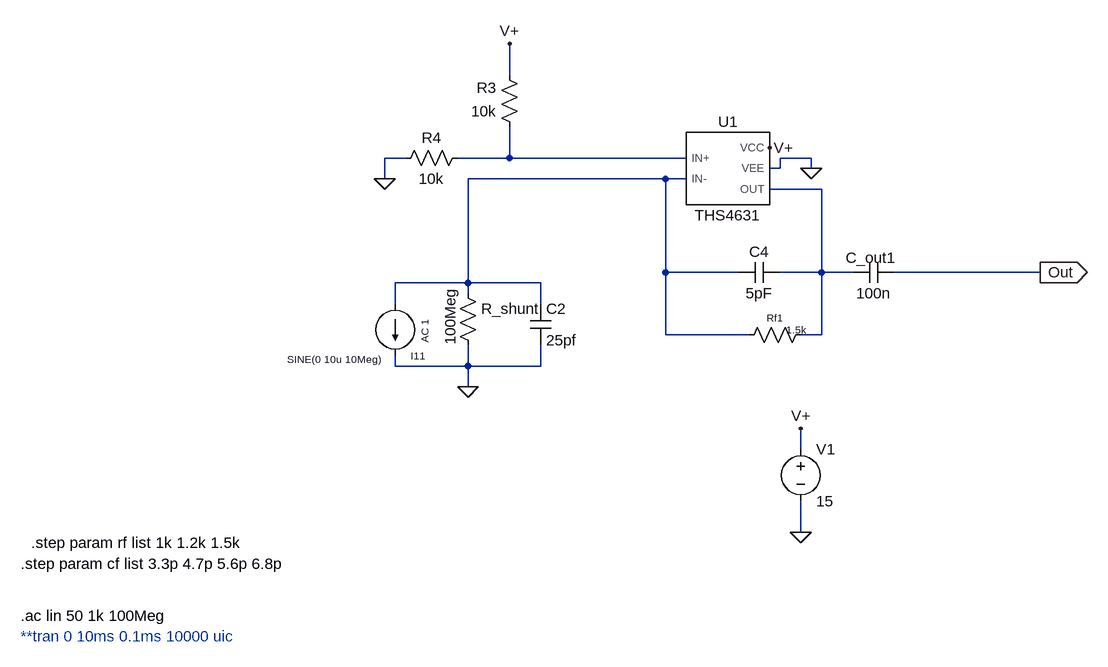
[diagram p0: schematic Receptor_V2_THS4631_b.asc]
Receptor_V2_THS4631_b.asc, the LTspice schematic file:
Version 4.1
SHEET 1 1892 1072
WIRE 784 -208 784 -256
WIRE 624 -80 592 -80
WIRE 784 -80 784 -128
WIRE 784 -80 704 -80
WIRE 1056 -80 784 -80
WIRE 1248 -80 1200 -80
WIRE 1200 -64 1200 -80
WIRE 1200 -64 1184 -64
WIRE 1248 -64 1248 -80
WIRE 592 -48 592 -80
WIRE 1024 -48 720 -48
WIRE 1056 -48 1024 -48
WIRE 1264 -32 1184 -32
WIRE 1024 96 1024 -48
WIRE 1136 96 1024 96
WIRE 1264 96 1264 -32
WIRE 1264 96 1200 96
WIRE 1312 96 1264 96
WIRE 1600 96 1376 96
WIRE 720 112 720 -48
WIRE 720 112 608 112
WIRE 832 112 720 112
WIRE 720 128 720 112
WIRE 608 144 608 112
WIRE 832 144 832 112
WIRE 1024 192 1024 96
WIRE 1152 192 1024 192
WIRE 1264 192 1264 96
WIRE 1264 192 1232 192
WIRE 608 240 608 224
WIRE 720 240 720 208
WIRE 720 240 608 240
WIRE 832 240 832 208
WIRE 832 240 720 240
WIRE 720 272 720 240
WIRE 1232 368 1232 336
WIRE 1232 496 1232 448
FLAG 1184 -96 V+
FLAG 1248 -64 0
FLAG 720 272 0
FLAG 1600 96 Out
IOPIN 1600 96 Out
FLAG 784 -256 V+
FLAG 592 -48 0
FLAG 1232 496 0
FLAG 1232 336 V+
SYMBOL THS4631 1120 -64 R0
SYMATTR InstName U1
SYMBOL res 1248 176 R90
WINDOW 0 0 56 VBottom 1
WINDOW 3 -2 23 VTop 1
SYMATTR InstName Rf1
SYMATTR Value 1.5k
SYMBOL cap 1376 80 R90
WINDOW 0 9 36 VBottom 2
WINDOW 3 32 32 VTop 2
SYMATTR InstName C_out1
SYMATTR Value 100n
SYMBOL current 608 144 R0
WINDOW 0 24 80 Left 1
WINDOW 3 -95 96 Bottom 1
WINDOW 123 46 60 VLeft 1
WINDOW 39 0 0 Left 0
SYMATTR InstName I11
SYMATTR Value SINE(0 10u 10Meg)
SYMATTR Value2 AC 1
SYMBOL cap 816 144 R0
SYMATTR InstName C2
SYMATTR Value 25pf
SYMBOL cap 1200 80 R90
WINDOW 0 0 32 VBottom 2
WINDOW 3 32 32 VTop 2
SYMATTR InstName C4
SYMATTR Value 5pF
SYMBOL res 800 -112 R180
WINDOW 0 36 76 Left 2
WINDOW 3 36 40 Left 2
SYMATTR InstName R3
SYMATTR Value 10k
SYMBOL res 608 -64 R270
WINDOW 0 32 56 VTop 2
WINDOW 3 0 56 VBottom 2
SYMATTR InstName R4
SYMATTR Value 10k
SYMBOL res 704 112 R0
WINDOW 3 -11 95 VLeft 2
SYMATTR Value 100Meg
SYMATTR InstName R_shunt
SYMBOL voltage 1232 352 R0
WINDOW 123 0 0 Left 0
WINDOW 39 0 0 Left 0
SYMATTR InstName V1
SYMATTR Value 15
TEXT 32 624 Left 2 !.ac lin 50 1k 100Meg
TEXT 32 656 Left 2 ;**tran 0 10ms 0.1ms 10000 uic
TEXT 32 544 Left 2 !.step param cf list 3.3p 4.7p 5.6p 6.8p
TEXT 48 512 Left 2 !.step param rf list 1k 1.2k 1.5k

The netlist it stands for:
* Receptor_V2_THS4631_b.asc
X§U1 N001 N002 V+ 0 N003 THS4631  ; pins IN+ IN- VCC VEE OUT
Rf1 N003 N002 1.5k
C_out1 Out N003 100n
I11 N002 0 SINE(0 10u 10Meg) AC 1
C2 N002 0 25pf
C4 N003 N002 5pF
R3 N001 V+ 10k
R4 0 N001 10k
R_shunt N002 0 100Meg
V1 V+ 0 15
.ac lin 50 1k 100Meg
* **tran 0 10ms 0.1ms 10000 uic
.step param cf list 3.3p 4.7p 5.6p 6.8p
.step param rf list 1k 1.2k 1.5k
.lib C:\Users\Jlsbe\Documents\Faculdade\ReceptorVLC\Simulações\Receptor\ths4631_b.lib
.backanno
.end